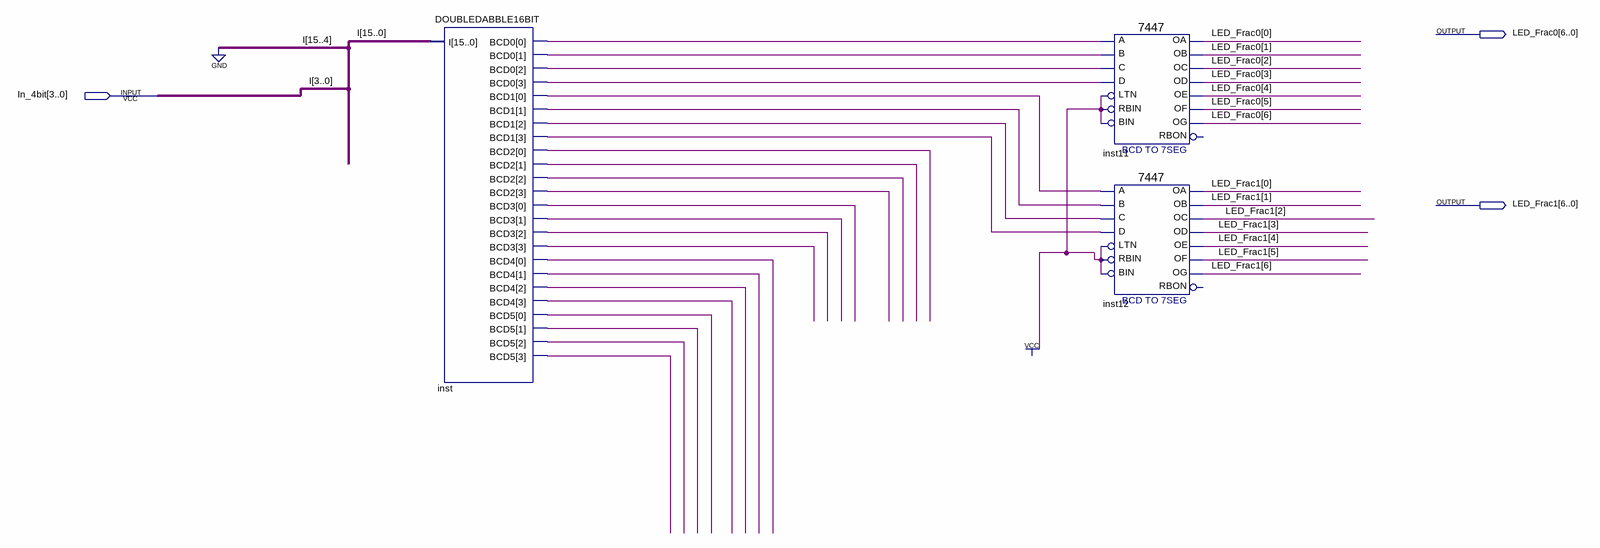
[diagram p0: schematic sheet]
// Quartus schematic Bi_4bit_to_7Seg.bdf as structural Verilog: 3 symbols, 3 pins
module Bi_4bit_to_7Seg (
  input  [3:0] In_4bit,
  output [6:0] LED_Frac0,
  output [6:0] LED_Frac1
);

  wire inst_bcd0, inst_bcd0_2, inst_bcd0_3, inst_bcd0_4, inst_bcd1, inst_bcd1_2, inst_bcd1_3, inst_bcd1_4,
       inst_bcd2, inst_bcd2_2, inst_bcd2_3, inst_bcd2_4, inst_bcd3, inst_bcd3_2, inst_bcd3_3, inst_bcd3_4,
       inst_bcd4, inst_bcd4_2, inst_bcd4_3, inst_bcd4_4, inst_bcd5, inst_bcd5_2, inst_bcd5_3, inst_bcd5_4;

  DOUBLEDABBLE16BIT inst (
    .I({{12{1'b0}}, In_4bit}), .BCD0({inst_bcd0_3, inst_bcd0_2, inst_bcd0, inst_bcd0_4}),
    .BCD1({inst_bcd1_3, inst_bcd1_2, inst_bcd1, inst_bcd1_4}),
    .BCD2({inst_bcd2_4, inst_bcd2_3, inst_bcd2_2, inst_bcd2}),
    .BCD3({inst_bcd3_4, inst_bcd3_3, inst_bcd3_2, inst_bcd3}),
    .BCD4({inst_bcd4_4, inst_bcd4_3, inst_bcd4_2, inst_bcd4}),
    .BCD5({inst_bcd5_4, inst_bcd5_3, inst_bcd5_2, inst_bcd5}));
  \7447  inst11 (
    .LTN(1'b1), .B(inst_bcd0), .C(inst_bcd0_2), .D(inst_bcd0_3), .RBIN(1'b1), .BIN(1'b1), .A(inst_bcd0_4),
    .OB(LED_Frac0[1]), .OC(LED_Frac0[2]), .OE(LED_Frac0[4]), .OD(LED_Frac0[3]), .OF(LED_Frac0[5]),
    .OG(LED_Frac0[6]), .OA(LED_Frac0[0]));  // open: RBON
  \7447  inst12 (
    .LTN(1'b1), .B(inst_bcd1), .C(inst_bcd1_2), .D(inst_bcd1_3), .RBIN(1'b1), .BIN(1'b1), .A(inst_bcd1_4),
    .OB(LED_Frac1[1]), .OC(LED_Frac1[2]), .OE(LED_Frac1[4]), .OD(LED_Frac1[3]), .OF(LED_Frac1[5]),
    .OG(LED_Frac1[6]), .OA(LED_Frac1[0]));  // open: RBON

  // Other names for the same wires on the sheet: I[3:0] = In_4bit
endmodule
